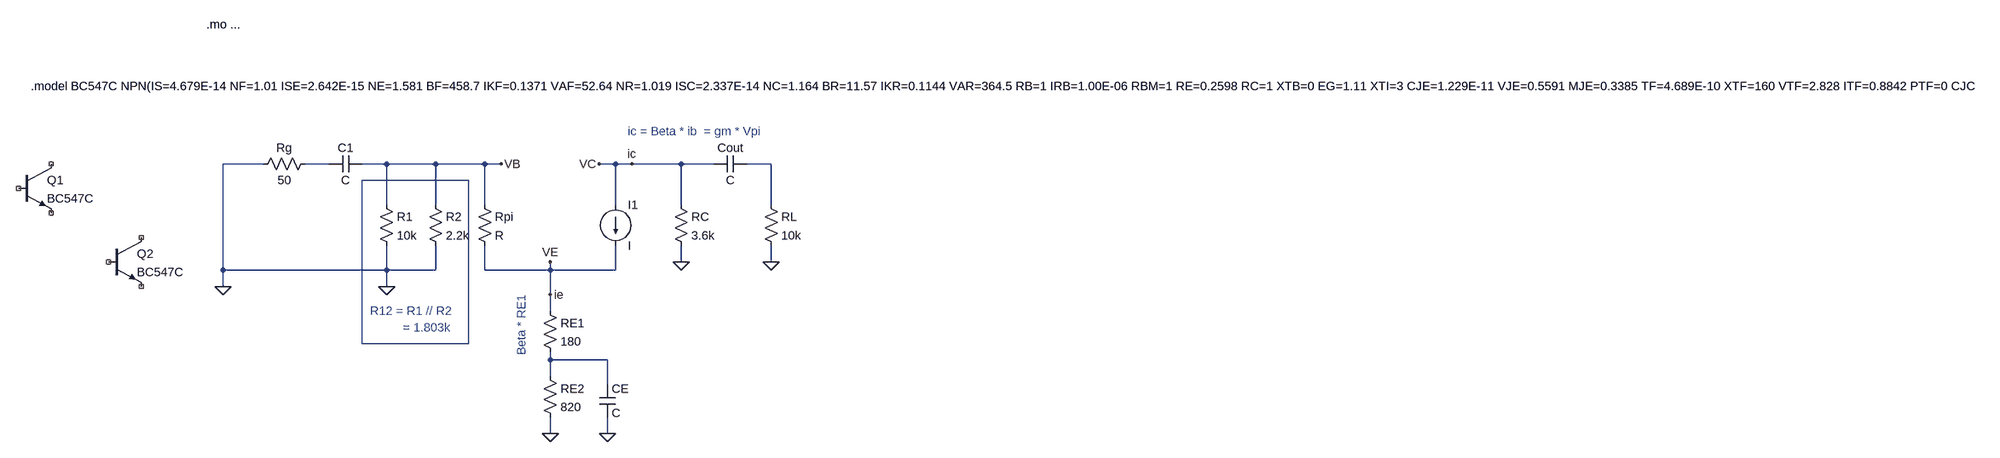
[diagram p0: schematic TP2_model_pi.asc]
TP2_model_pi.asc, the LTspice schematic file:
Version 4
SHEET 1 7796 1460
WIRE 272 912 192 912
WIRE 400 912 352 912
WIRE 512 912 464 912
WIRE 608 912 512 912
WIRE 704 912 608 912
WIRE 736 912 704 912
WIRE 960 912 928 912
WIRE 992 912 960 912
WIRE 1088 912 992 912
WIRE 1152 912 1088 912
WIRE 1264 912 1216 912
WIRE 672 944 464 944
WIRE 512 992 512 912
WIRE 608 992 608 912
WIRE 704 992 704 912
WIRE 960 992 960 912
WIRE 1088 992 1088 912
WIRE 1264 992 1264 912
WIRE 1088 1104 1088 1072
WIRE 1264 1104 1264 1072
WIRE 192 1120 192 912
WIRE 512 1120 512 1072
WIRE 512 1120 192 1120
WIRE 608 1120 608 1072
WIRE 608 1120 512 1120
WIRE 704 1120 704 1072
WIRE 832 1120 832 1104
WIRE 832 1120 704 1120
WIRE 960 1120 960 1072
WIRE 960 1120 832 1120
WIRE 192 1152 192 1120
WIRE 512 1152 512 1120
WIRE 832 1168 832 1120
WIRE 832 1200 832 1168
WIRE 464 1264 464 944
WIRE 672 1264 672 944
WIRE 672 1264 464 1264
WIRE 832 1296 832 1280
WIRE 944 1296 832 1296
WIRE 832 1328 832 1296
WIRE 944 1344 944 1296
WIRE 832 1440 832 1408
WIRE 944 1440 944 1408
FLAG 192 1152 0
FLAG 512 1152 0
FLAG 736 912 VB
FLAG 832 1440 0
FLAG 944 1440 0
FLAG 1088 1104 0
FLAG 1264 1104 0
FLAG 928 912 VC
FLAG 832 1104 VE
FLAG 832 1168 ie
FLAG 992 912 ic
SYMBOL cap 464 896 R90
WINDOW 0 0 32 VBottom 2
WINDOW 3 32 32 VTop 2
SYMATTR InstName C1
SYMBOL res 496 976 R0
SYMATTR InstName R1
SYMATTR Value 10k
SYMBOL current 960 992 R0
SYMATTR InstName I1
SYMBOL res 368 896 R90
WINDOW 0 0 56 VBottom 2
WINDOW 3 32 56 VTop 2
SYMATTR InstName Rg
SYMATTR Value 50
SYMBOL res 592 976 R0
SYMATTR InstName R2
SYMATTR Value 2.2k
SYMBOL res 688 976 R0
SYMATTR InstName Rpi
SYMBOL res 816 1184 R0
SYMATTR InstName RE1
SYMATTR Value 180
SYMBOL res 816 1312 R0
SYMATTR InstName RE2
SYMATTR Value 820
SYMBOL cap 928 1344 R0
SYMATTR InstName CE
SYMBOL res 1072 976 R0
SYMATTR InstName RC
SYMATTR Value 3.6k
SYMBOL res 1248 976 R0
SYMATTR InstName RL
SYMATTR Value 10k
SYMBOL cap 1216 896 R90
WINDOW 0 0 32 VBottom 2
WINDOW 3 32 32 VTop 2
SYMATTR InstName Cout
SYMBOL npn -208 912 R0
SYMATTR InstName Q1
SYMATTR Value BC547C
SYMBOL npn -32 1056 R0
SYMATTR InstName Q2
SYMATTR Value BC547C
TEXT -184 760 Left 2 !.model BC547C NPN(IS=4.679E-14 NF=1.01 ISE=2.642E-15 NE=1.581 BF=458.7 IKF=0.1371 VAF=52.64 NR=1.019 ISC=2.337E-14 NC=1.164 BR=11.57 IKR=0.1144 VAR=364.5 RB=1 IRB=1.00E-06 RBM=1 RE=0.2598 RC=1 XTB=0 EG=1.11 XTI=3 CJE=1.229E-11 VJE=0.5591 MJE=0.3385 TF=4.689E-10 XTF=160 VTF=2.828 ITF=0.8842 PTF=0 CJC=4.42E-12 VJC=0.1994 MJC=0.2782 XCJC=0.6193 TR=1.00E-32 CJS=0 VJS=0.75 MJS=0.333 FC=0.7936 Vceo=45 Icrating=100m mfg=Philips)
TEXT 776 1168 VRight 2 ;Beta * RE1
TEXT 984 848 Left 2 ;ic = Beta * ib  = gm * Vpi
TEXT 480 1200 Left 2 ;R12 = R1 // R2
TEXT 544 1232 Left 2 ;= 1.803k
TEXT 160 632 Left 2 !.mo ...

The netlist it stands for:
* TP2_model_pi.asc
C1 VB N001 C
R1 VB 0 10k
I1 ic ie I
Rg N001 0 50
R2 VB 0 2.2k
Rpi VB ie R
RE1 ie N004 180
RE2 N004 0 820
CE N004 0 C
RC ic 0 3.6k
RL N002 0 10k
Cout N002 ic C
Q1 NC_01 NC_02 NC_03 0 BC547C
Q2 NC_04 NC_05 NC_06 0 BC547C
.model NPN NPN
.model PNP PNP
.lib standard.bjt
.model BC547C NPN(IS=4.679E-14 NF=1.01 ISE=2.642E-15 NE=1.581 BF=458.7 IKF=0.1371 VAF=52.64 NR=1.019 ISC=2.337E-14 NC=1.164 BR=11.57 IKR=0.1144 VAR=364.5 RB=1 IRB=1.00E-06 RBM=1 RE=0.2598 RC=1 XTB=0 EG=1.11 XTI=3 CJE=1.229E-11 VJE=0.5591 MJE=0.3385 TF=4.689E-10 XTF=160 VTF=2.828 ITF=0.8842 PTF=0 CJC=4.42E-12 VJC=0.1994 MJC=0.2782 XCJC=0.6193 TR=1.00E-32 CJS=0 VJS=0.75 MJS=0.333 FC=0.7936 Vceo=45 Icrating=100m mfg=Philips)
* Beta * RE1
* ic = Beta * ib  = gm * Vpi
* R12 = R1 // R2
* = 1.803k
.mo ...
.backanno
.end